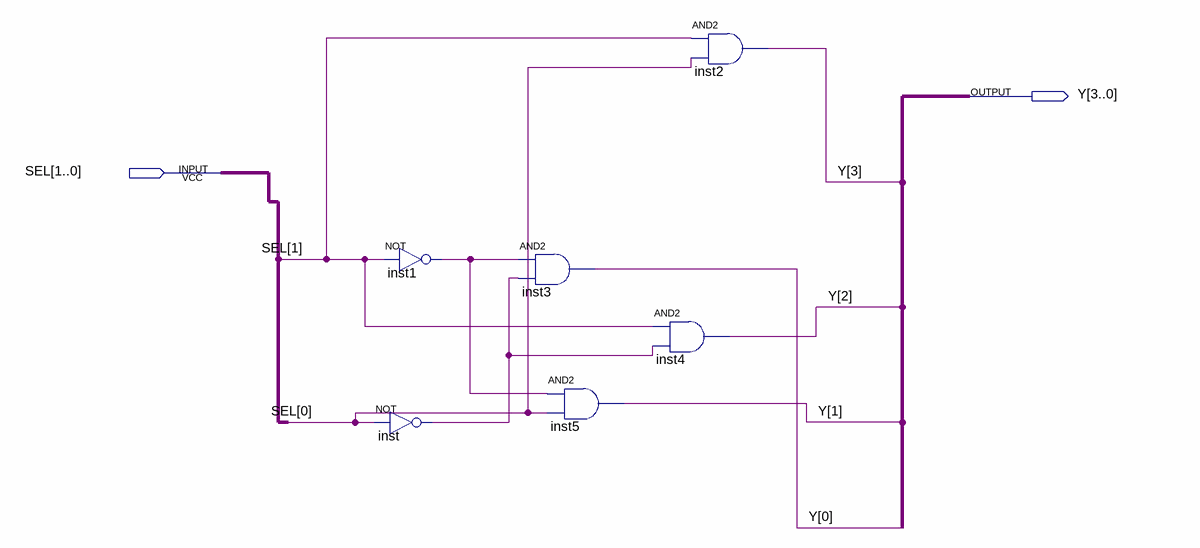
[diagram p0: schematic sheet]
// Quartus schematic decoder2to4_hxgdly.bdf as structural Verilog: 6 symbols, 2 pins
module decoder2to4_hxgdly (
  input  [1:0] SEL,
  output [3:0] Y
);

  wire inst1_out, inst_out;

  not inst1 (inst1_out, SEL[1]);
  not inst (inst_out, SEL[0]);
  and inst3 (Y[0], inst1_out, inst_out);
  and inst5 (Y[1], inst1_out, SEL[0]);
  and inst4 (Y[2], SEL[1], inst_out);
  and inst2 (Y[3], SEL[1], SEL[0]);
endmodule
